# Altium schematic sheet 02.C205. A01-A11. Module BASU Encoder for Horizontal motor.SchDoc: Кабель энкодера двигателя ГН
size 209 x 297 mm; Author: Мурашкин Д.В.; Address1: Address1; Address2: Address2; Address3: Address3; Address4: Address4; DocumentNumber: ИЗДЕЛИЕ-1-2; SheetNumber: 17; Scale: 1:1; Letter1Column: Э
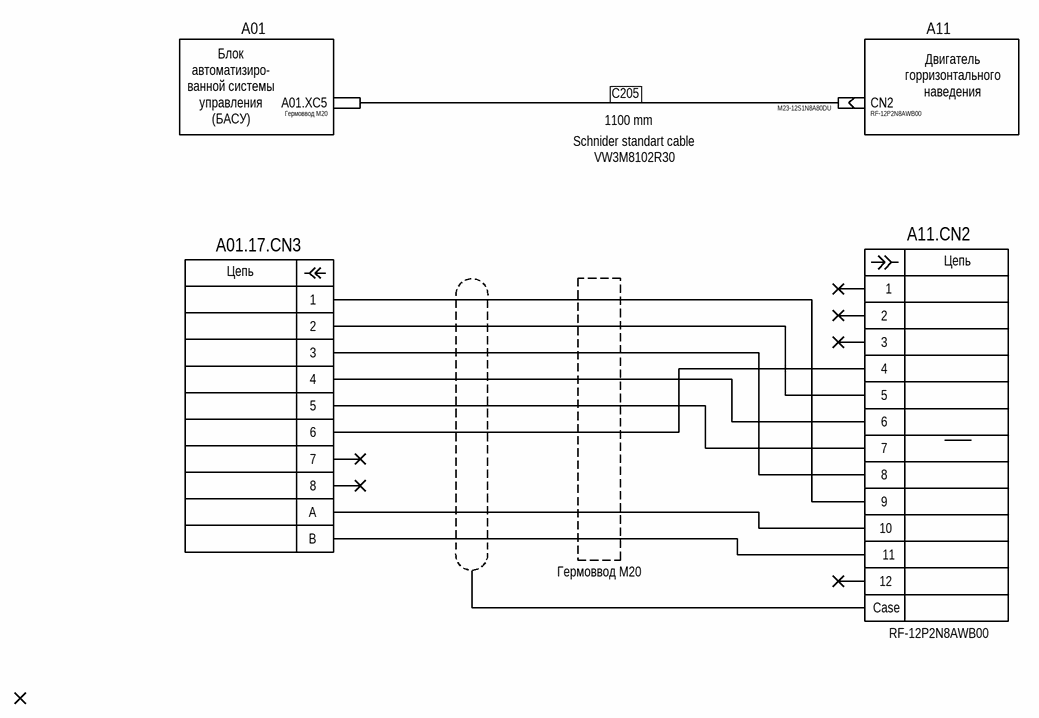
[diagram p0: 02.C205. A01-A11. Module BASU Encoder for Horizontal motor.SchDoc]

## Parts
A01.17.CN3  (no value)
A01.XC5  Гермоввод М20
A11.CN2  RF-12P2N8AWB00
A?  M23-12S1N8A80DU  (no BOM)
CN2  RF-12P2N8AWB00  (no BOM)

## Blocks framed on the sheet
A11: CN2

## Nets
С205: A01.XC5.1 A?.0
NetA01.17.CN3_1: A01.17.CN3.1 A11.CN2.9
NetA01.17.CN3_2: A01.17.CN3.2 A11.CN2.5
NetA01.17.CN3_3: A01.17.CN3.3 A11.CN2.8
NetA01.17.CN3_4: A01.17.CN3.4 A11.CN2.6
NetA01.17.CN3_5: A01.17.CN3.5 A11.CN2.7
NetA01.17.CN3_6: A01.17.CN3.6 A11.CN2.4
NetA01.17.CN3_A: A01.17.CN3.A A11.CN2.10
NetA01.17.CN3_B: A01.17.CN3.B A11.CN2.11

Not connected (* = marked no-connect by the designer): A01.17.CN3 7* 8*; A01.XC5 0; A11.CN2 1* 2* 3* 12* Case; CN2 0

## Notes on the sheet
- A01
- (near CN2) Двигатель горризонтального наведения
- Блок автоматизиро- ванной системы управления (БАСУ)
- Schnider standart cable
- VW3M8102R30
- 1100 mm
- Гермоввод М20
- Перв. примен.
- Справ. №
- Подп. и дата
- Инв. № дубл.
- Взам. инв. №
- Инв. № подл.
- Изм.
- Лист
- № докум.
- Подп.
- Дата
- 2.106-A4
- Копировал
- Формат А4
- (in symbol Connector signal P12 MIL_1_1) Цепь
- (in symbol Motor BMH0 connection CN2) Цепь

## Library data of the parts
A01.17.CN3 = Connector signal P12 MIL_1_1: P10_MIL; Operating temperature: -°C +°C; Mounting type: Surface mount; Dimension: .0mm x .0mm; Height: .0mm
A01.XC5 = Connector cable coupling: Operating temperature: -°C +°C; Mounting type: Surface mount; Dimension: .0mm x .0mm; Height: .0mm
A11.CN2 = Motor BMH0 connection CN2: Operating temperature: -°C +°C; Mounting type: Surface mount; Dimension: .0mm x .0mm; Height: .0mm
A? = Connector cable socket: Manufacturer: Phoenix Contact; Part name: M23-12S1N8A80DU; Operating temperature: -°C +°C; Mounting type: Cable mount; Dimension: .0mm x .0mm; Height: .0mm
CN2 = Connector cable plug: Manufacturer: Phoenix Contact; Part name: RF-12P2N8AWB00; Operating temperature: -°C +°C; Mounting type: Panel mount; Dimension: .0mm x .0mm; Height: .0mm